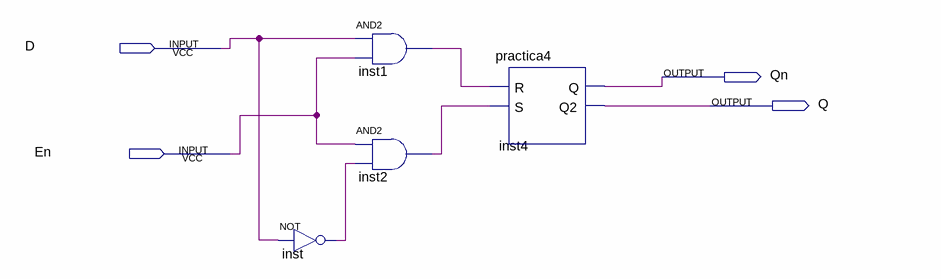
[diagram p0: schematic sheet]
// Quartus schematic Block3.bdf as structural Verilog: 4 symbols, 4 pins
module Block3 (
  input  D,
  input  En,
  output Qn,
  output Q
);

  wire inst1_out, inst2_out, inst_out;

  not inst (inst_out, D);
  and inst1 (inst1_out, D, En);
  and inst2 (inst2_out, En, inst_out);
  practica4 inst4 (.R(inst1_out), .S(inst2_out), .Q(Qn), .Q2(Q));
endmodule
